# Altium schematic sheet DAC、ADC、IO_Espander.SchDoc
size A4; SheetNumber: 6; SheetTotal: 7
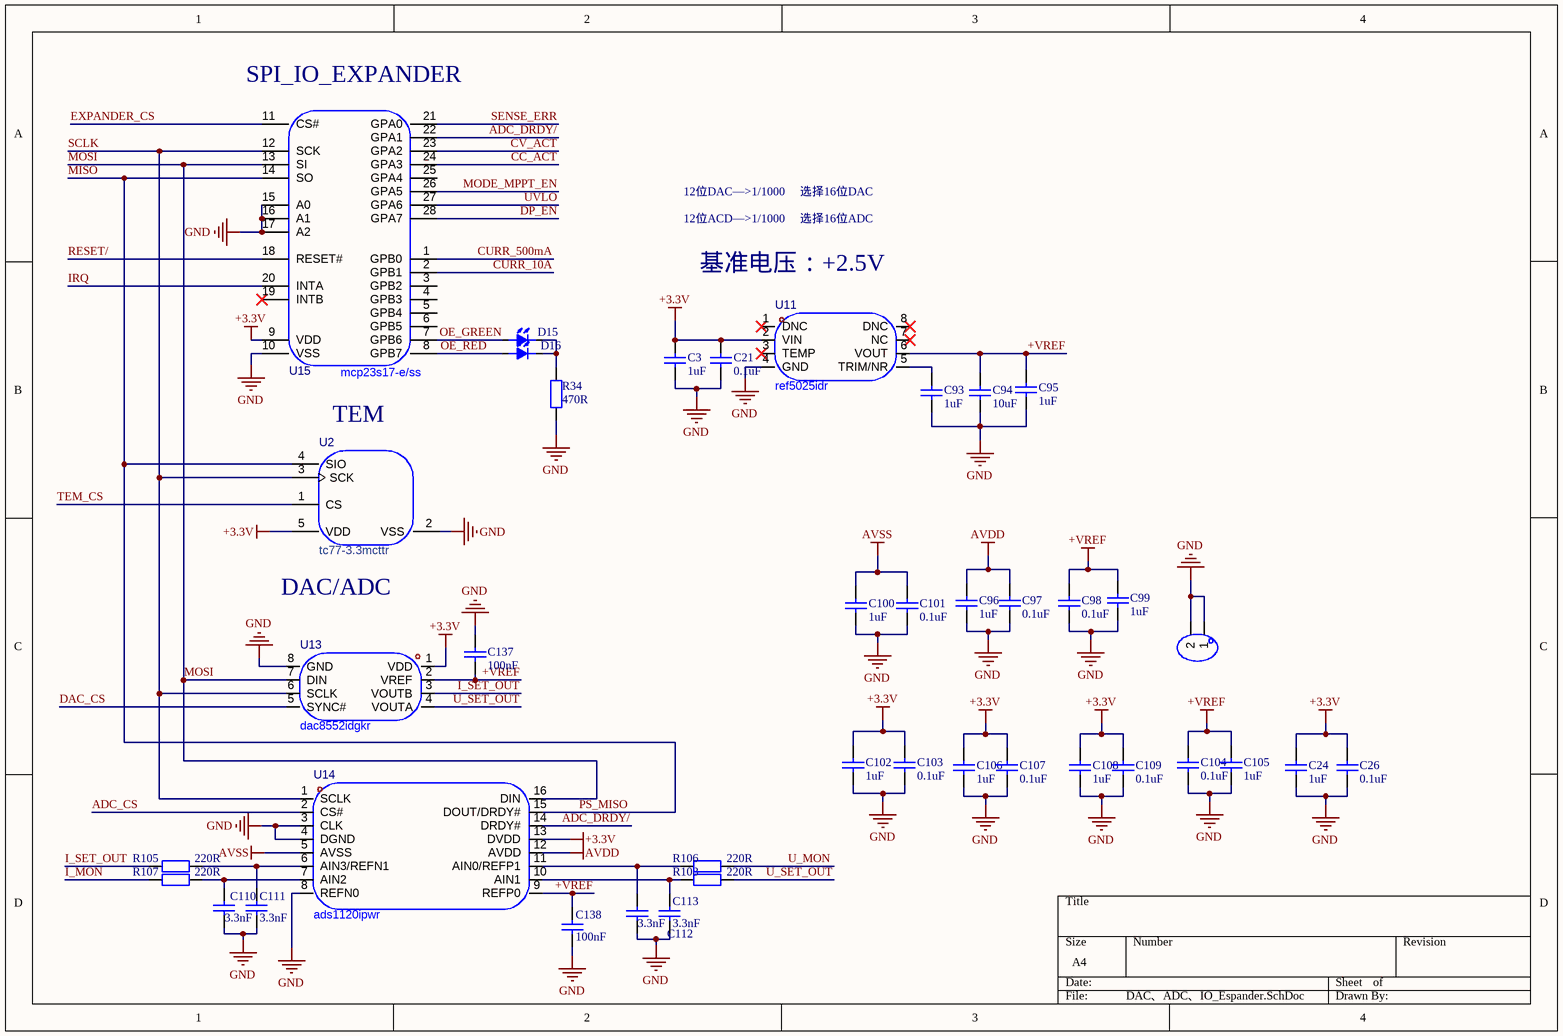
[diagram p0: DAC、ADC、IO_Espander.SchDoc]

## Parts
C3  1uF  [C0603]
C21  0.1uF  [C0603]
C24  1uF  [C0603]
C26  0.1uF  [C0603]
C93  1uF  [C0603]
C94  10uF  [C0603]
C95  1uF  [C0603]
C96  1uF  [C0603]
C97  0.1uF  [C0603]
C98  0.1uF  [C0603]
C99  1uF  [C0603]
C100  1uF  [C0603]
C101  0.1uF  [C0603]
C102  1uF  [C0603]
C103  0.1uF  [C0603]
C104  0.1uF  [C0603]
C105  1uF  [C0603]
C106  1uF  [C0603]
C107  0.1uF  [C0603]
C108  1uF  [C0603]
C109  0.1uF  [C0603]
C110  3.3nF  [C0603]
C111  3.3nF  [C0603]
C112  3.3nF  [C0603]
C113  3.3nF  [C0603]
C137  100nF  [C0603]
C138  100nF  [C0603]
D15  DIO_LED  [LED0603-RD_RED]  (value not drawn)
D16  DIO_LED  [LED0603-RD_RED]  (value not drawn)
H6  pz254v-11-02p  [HDR-TH_2P-P2.54-V-M]  (value not drawn)
R34  470R  [R0603]
R105  220R  [R0603]
R106  220R  [R0603]
R107  220R  [R0603]
R108  220R  [R0603]
U2  tc77-3.3mcttr  [SOT-23-5_L3.0-W1.7-P0.95-LS2.8-BL]
U11  ref5025idr  [SOIC-8_L4.9-W3.9-P1.27-LS6.0-BL]
U13  dac8552idgkr  [VSSOP-8_L3.0-W3.0-P0.65-LS5.0-BL]
U14  ads1120ipwr  [TSSOP-16_L5.0-W4.4-P0.65-LS6.4-BL]
U15  mcp23s17-e/ss  [SSOP-28_L10.2-W5.3-P0.65-LS7.8-BL]

## Nets
+3.3V: C3.2 C21.2 C24.2 C26.2 C102.2 C103.2 C106.2 C107.2 C108.2 C109.2 U2.5(VDD) U11.2(VIN) U13.1(VDD) U14.13(DVDD) U15.9(VDD)
+VREF: C94.2 C95.2 C98.2 C99.2 C104.2 C105.2 C137.2 C138.2 U11.6(VOUT) U13.2(VREF) U14.9(REFP0)
AVDD: C96.2 C97.2 U14.12(AVDD)
AVSS: C100.2 C101.2 U14.5(AVSS)
GND: C3.1 C21.1 C24.1 C26.1 C93.1 C94.1 C95.1 C96.1 C97.1 C98.1 C99.1 C100.1 C101.1 C102.1 C103.1 C104.1 C105.1 C106.1 C107.1 C108.1 C109.1 C110.1 C111.1 C112.1 C113.1 C137.1 C138.1 H6.1 H6.2 R34.2 U2.2(VSS) U11.4(GND) U13.8(GND) U14.3(CLK) U14.4(DGND) U14.8(REFN0) U15.10(VSS) U15.15(A0) U15.16(A1) U15.17(A2)
ADC_CS: U14.2(CS#)
ADC_DRDY/: U14.14(DRDY#) U15.22(GPA1)
CC_ACT: U15.24(GPA3)
CURR_10A: U15.2(GPB1)
CURR_500mA: U15.1(GPB0)
CV_ACT: U15.23(GPA2)
DAC_CS: U13.5(SYNC#)
DP_EN: U15.28(GPA7)
EXPANDER_CS: U15.11(CS#)
I_MON: R107.1
I_SET_OUT: R105.1 U13.3(VOUTB)
IRQ: U15.20(INTA)
MISO: U2.4(SIO) U14.15(DOUT/DRDY#) U15.14(SO)  [also labelled PS_MISO]
MODE_MPPT_EN: U15.26(GPA5)
MOSI: U13.7(DIN) U14.16(DIN) U15.13(SI)
OE_GREEN: D15.2 U15.7(GPB6)
OE_RED: D16.2 U15.8(GPB7)
RESET/: U15.18(RESET#)
SCLK: U2.3(SCK) U13.6(SCLK) U14.1(SCLK) U15.12(SCK)
SENSE_ERR: U15.21(GPA0)
TEM_CS: U2.1(CS)
U_MON: R106.2
U_SET_OUT: R108.2 U13.4(VOUTA)
UVLO: U15.27(GPA6)
NetC93_2: C93.2 U11.5(TRIM/NR)
NetC110_2: C110.2 R107.2 U14.7(AIN2)
NetC111_2: C111.2 R105.2 U14.6(AIN3/REFN1)
NetC112_2: C112.2 R106.1 U14.11(AIN0/REFP1)
NetC113_2: C113.2 R108.1 U14.10(AIN1)
NetD15_1: D15.1 D16.1 R34.1

Not connected (* = marked no-connect by the designer): U11 1(DNC)* 3(TEMP)* 7(NC)* 8(DNC)*; U15 3(GPB2) 4(GPB3) 5(GPB4) 6(GPB5) 19(INTB)* 25(GPA4)

## Notes on the sheet
- (near U15) SPI_IO_EXPANDER
- 12位DAC—>1/1000     选择16位DAC
- 12位ACD—>1/1000     选择16位ADC
- 基准电压：+2.5V
- TEM
- DAC/ADC

## Library data of the parts
C3 C21 C24 C26 C93-C113 C137 C138 = C0603: Capacitor; Value: 104; Published: 8-Jun-2000; LatestRevisionDate: 17-Jul-2002; LatestRevisionNote: Re-released for DXP Platform.; Publisher: Altium Limited
D15 D16 = DIO_LED: Brand: LED; Part Number: *
H6 = pz254v-11-02p: 插针结构:1x2P;间距:2.54mm;行距:-;圆针/方针:方针;安装方式:直插;排数:单排;总PIN位数:2P;额定电流:3A;额定电压:250V;配合针长度:6mm;塑高:2.5mm;端接针长度:3mm;触头材质:黄铜;触头镀层:-;工作温度:-40℃~+105℃;颜色:黑色;; Manufacturer: XFCN(兴飞); AddInBom: yes; ModelId: e35305ec3aa84b66b849f914b715e73f; ModelName: HDR2.54-M-LI-1X2P; ModelTransform: 200,100,0,0,0,0,0,0,-118.11; Pin Structure: 1x2P; Pitch: 2.54mm; Circluar Pins/Square Pins: 方针; Current Rating: 3A; Voltage Rating (Max): 250V; Symbol: PZ254V-11-02P; LCSC Part Name: 1x2P 间距:2.54mm 方针 直插; SupplierPart: C492401; ManufacturerPart: PZ254V-11-02P; Supplier Footprint: 插件,P=2.54mm; JLCPCB Part Class: Extended Part; Datasheet: https://item.szlcsc.com/datasheet/PZ254V-11-02P/502957.html; Supplier: LCSC; ConvertToPcb: yes; FootprintName: HDR-TH_2P-P2.54-V-M; Row Spacing: -; Mounting Type: 直插; Number of Rows: 单排; Number of Pins: 2P; Length of Mating Pin: 6mm; Insulation Height: 2.5mm; Length of End Connection Pin: 3mm; Contact Material: 黄铜; Contact Plating: -; Operating Temperature: -40℃~+105℃; Color: 黑色
R34 R105-R108 = R0603: Resistor; Published: 8-Jun-2000; LatestRevisionDate: 17-Jul-2002; LatestRevisionNote: Re-released for DXP Platform.; Publisher: Altium Limited
U2 = tc77-3.3mcttr_1: 检测温度:-55℃~+125℃;精度:±1℃;接口类型:SPI;; Manufacturer: MICROCHIP(美国微芯); AddInBom: yes; ModelId: 0a2a1b8f50944f73965918ad6e5fe167; ModelName: SOT-23-5_L2.9-W1.6-H1.1-LS2.8-P0.95; ModelTransform: 118.60433,114.173,0,90,0,0,0.0005,0.0005,0; Tolerance: ±1℃; Voltage - Supply: 2.7V~5.5V; Standby Current: 1uA; Interface: SPI; Temperature Conversion Time: 300ms; Temperature Resolution: 13bit; Symbol: TC77-3.3MCTTR; LCSC Part Name: 带SPI接口的温度传感器; SupplierPart: C56616; ManufacturerPart: TC77-3.3MCTTR; Supplier Footprint: SOT-23-5; JLCPCB Part Class: Extended Part; Datasheet: https://item.szlcsc.com/datasheet/TC77-3.3MCTTR/57645.html; Supplier: LCSC; ConvertToPcb: yes; FootprintName: SOT-23-5_L3.0-W1.7-P0.95-LS2.8-BL; Detection Temperature Range: -55℃~+125℃; Operating Temperature: -
U11 = ref5025idr: 输出类型:固定;输入电压:2.7V~18V;输出电压:2.5V;输出电流:10mA;精度:±0.05%;; Manufacturer: TI(德州仪器); AddInBom: yes; ModelId: e81d2f7d937b4a6ab1dca543ff5d56a4; ModelName: SOIC-8_L4.9-W3.9-H1.7-LS6.0-P1.27; ModelTransform: 192.913,236.22,0,0,0,0,0,0,0; Output Type: 固定; Output Voltage: 2.5V; Output Current: 10mA; Tolerance: ±0.05%; Temperature Coefficient: 3ppm/℃; Reference Type: 串联; Supply Current: 1.2mA; Noise - 1/10Hz to 10Hz: 3uVp-p; Symbol: REF5025IDR; LCSC Part Name: REF5025IDR; SupplierPart: C544535; ManufacturerPart: REF5025IDR; Supplier Footprint: SOIC-8; JLCPCB Part Class: Extended Part; Datasheet: https://www.ti.com/cn/lit/gpn/ref5030; Supplier: LCSC; ConvertToPcb: yes; FootprintName: SOIC-8_L4.9-W3.9-P1.27-LS6.0-BL; Input Voltage: 2.7V~18V; Noise - 10Hz to 10kHz: -; Operating Temperature: -40℃~+125℃@(Ta)
U13 = dac8552idgkr: 分辨率(位):16位;接口类型:SPI;工作电压:2.7V~5.5V;稳定时间:10us;积分非线性:4LSB;; Manufacturer: TI(德州仪器); AddInBom: yes; ModelId: fe8ada2663e64b00b932016623def703; ModelName: VSSOP-8_L3.0-W3.0-H1.1-LS4.9-P0.65; ModelTransform: 197.34433,118.11,0,90,0,0,0,0.0005,0; Resolution(Bits): 16位; Number of Channels: 2; Interface: SPI; Settling Time: 10us; Output Type: 电压-缓冲; Integral non - linearity: 4LSB; Power-On Reset: 内置; Voltage Reference: 外置; Quiescent Current (Iq): 700nA; Symbol: DAC8552IDGKR; LCSC Part Name: 16位、双通道、电压输出数模转换器; SupplierPart: C136020; ManufacturerPart: DAC8552IDGKR; Supplier Footprint: MSOP-8; JLCPCB Part Class: Extended Part; Datasheet: https://www.ti.com/cn/lit/gpn/dac8552; Supplier: LCSC; ConvertToPcb: yes; FootprintName: VSSOP-8_L3.0-W3.0-P0.65-LS5.0-BL; Voltage - Supply: 2.7V~5.5V; Operating Temperature: -40℃~+105℃; Sampling Rate: -; Voltage Reference Drift: -; Data rate: -
U14 = ads1120ipwr: 分辨率(位):16;采样率:2kHz;工作电压:2.3V~5.5V;接口类型:SPI;; Manufacturer: TI(德州仪器); AddInBom: yes; ModelId: e184b9ae7def452b81228c95a013214c; ModelName: TSSOP-16_L5.0-W4.4-H1.0-LS6.4-P0.65; ModelTransform: 252.188,196.85,0,90,0,0,0,0.005,0; Resolution (Bits): 16; Sampling Rate: 2kHz; number of channels: 4; Interface: SPI; differential input: 是; Clock/Oscillator: 内置; Clock Frequency: 500kHz~4.5MHz；4.096MHz; Voltage Reference Drift: 5ppm/℃; Programmable Gain: 支持; ADC architecture: Sigma-Delta; Data rate: 660Hz；350Hz；2kHz；1.2kHz；180Hz；90Hz; Quiescent Current (Iq): 120uA; Symbol: ADS1120IPWR; LCSC Part Name: 4通道、2kSPS、低功耗、16位ADC，具有集成PGA和基准; SupplierPart: C84284; ManufacturerPart: ADS1120IPWR; Supplier Footprint: TSSOP-16; JLCPCB Part Class: Extended Part; Datasheet: https://www.ti.com/cn/lit/gpn/ads1120; Supplier: LCSC; ConvertToPcb: yes; FootprintName: TSSOP-16_L5.0-W4.4-P0.65-LS6.4-BL; Voltage - Supply: 2.3V~5.5V; Integral non - linearity: -; Operating Temperature: -40℃~+125℃; Signal-to-Noise Ratio: -; Voltage Reference: 内置; Temperature Sensors: 内置; Full-Scale Range(FSR): -
U15 = mcp23s17-e/ss: 接口类型:SPI;I/O数量:16;时钟频率(fc):10MHz;; Manufacturer: MICROCHIP(美国微芯); AddInBom: yes; ModelId: 0c45916be1b748f191431a304285089a; ModelName: SSOP-28_L10.2-W5.3-H2.0-LS7.8-P0.65; ModelTransform: 401.574,307.086,0,0,0,0,0,0,0; Interface: SPI; Number of I/O: 16; Interrupt Output: 有中断输出; Current - Output Low(IOL): 8mA; Current - Output High(IOH): 3mA; Clock Frequency: 10MHz; Number of Supporting Devices: 8; Quiescent Supply Current: 1uA; Output Logic Level - Low: 600mV; Voltage - Supply: 1.8V~5.5V; Symbol: MCP23S17-E/SS; LCSC Part Name: 带有串行接口的16位I/O扩展器; SupplierPart: C148009; ManufacturerPart: MCP23S17-E/SS; Supplier Footprint: SSOP-28-208mil; JLCPCB Part Class: Extended Part; Datasheet: https://item.szlcsc.com/datasheet/MCP23S17-E%252FSS/159342.html; Supplier: LCSC; ConvertToPcb: yes; FootprintName: SSOP-28_L10.2-W5.3-P0.65-LS7.8-BL; Output Type: -; Output Logic Level - High: -; Features: 复位功能；级联与地址扩展; Operating Temperature: -40℃~+125℃